# Altium schematic sheet 02_PHY_Automotive.SchDoc (part 1 of 2)
size B; SheetNumber: 2; SheetTotal: 5
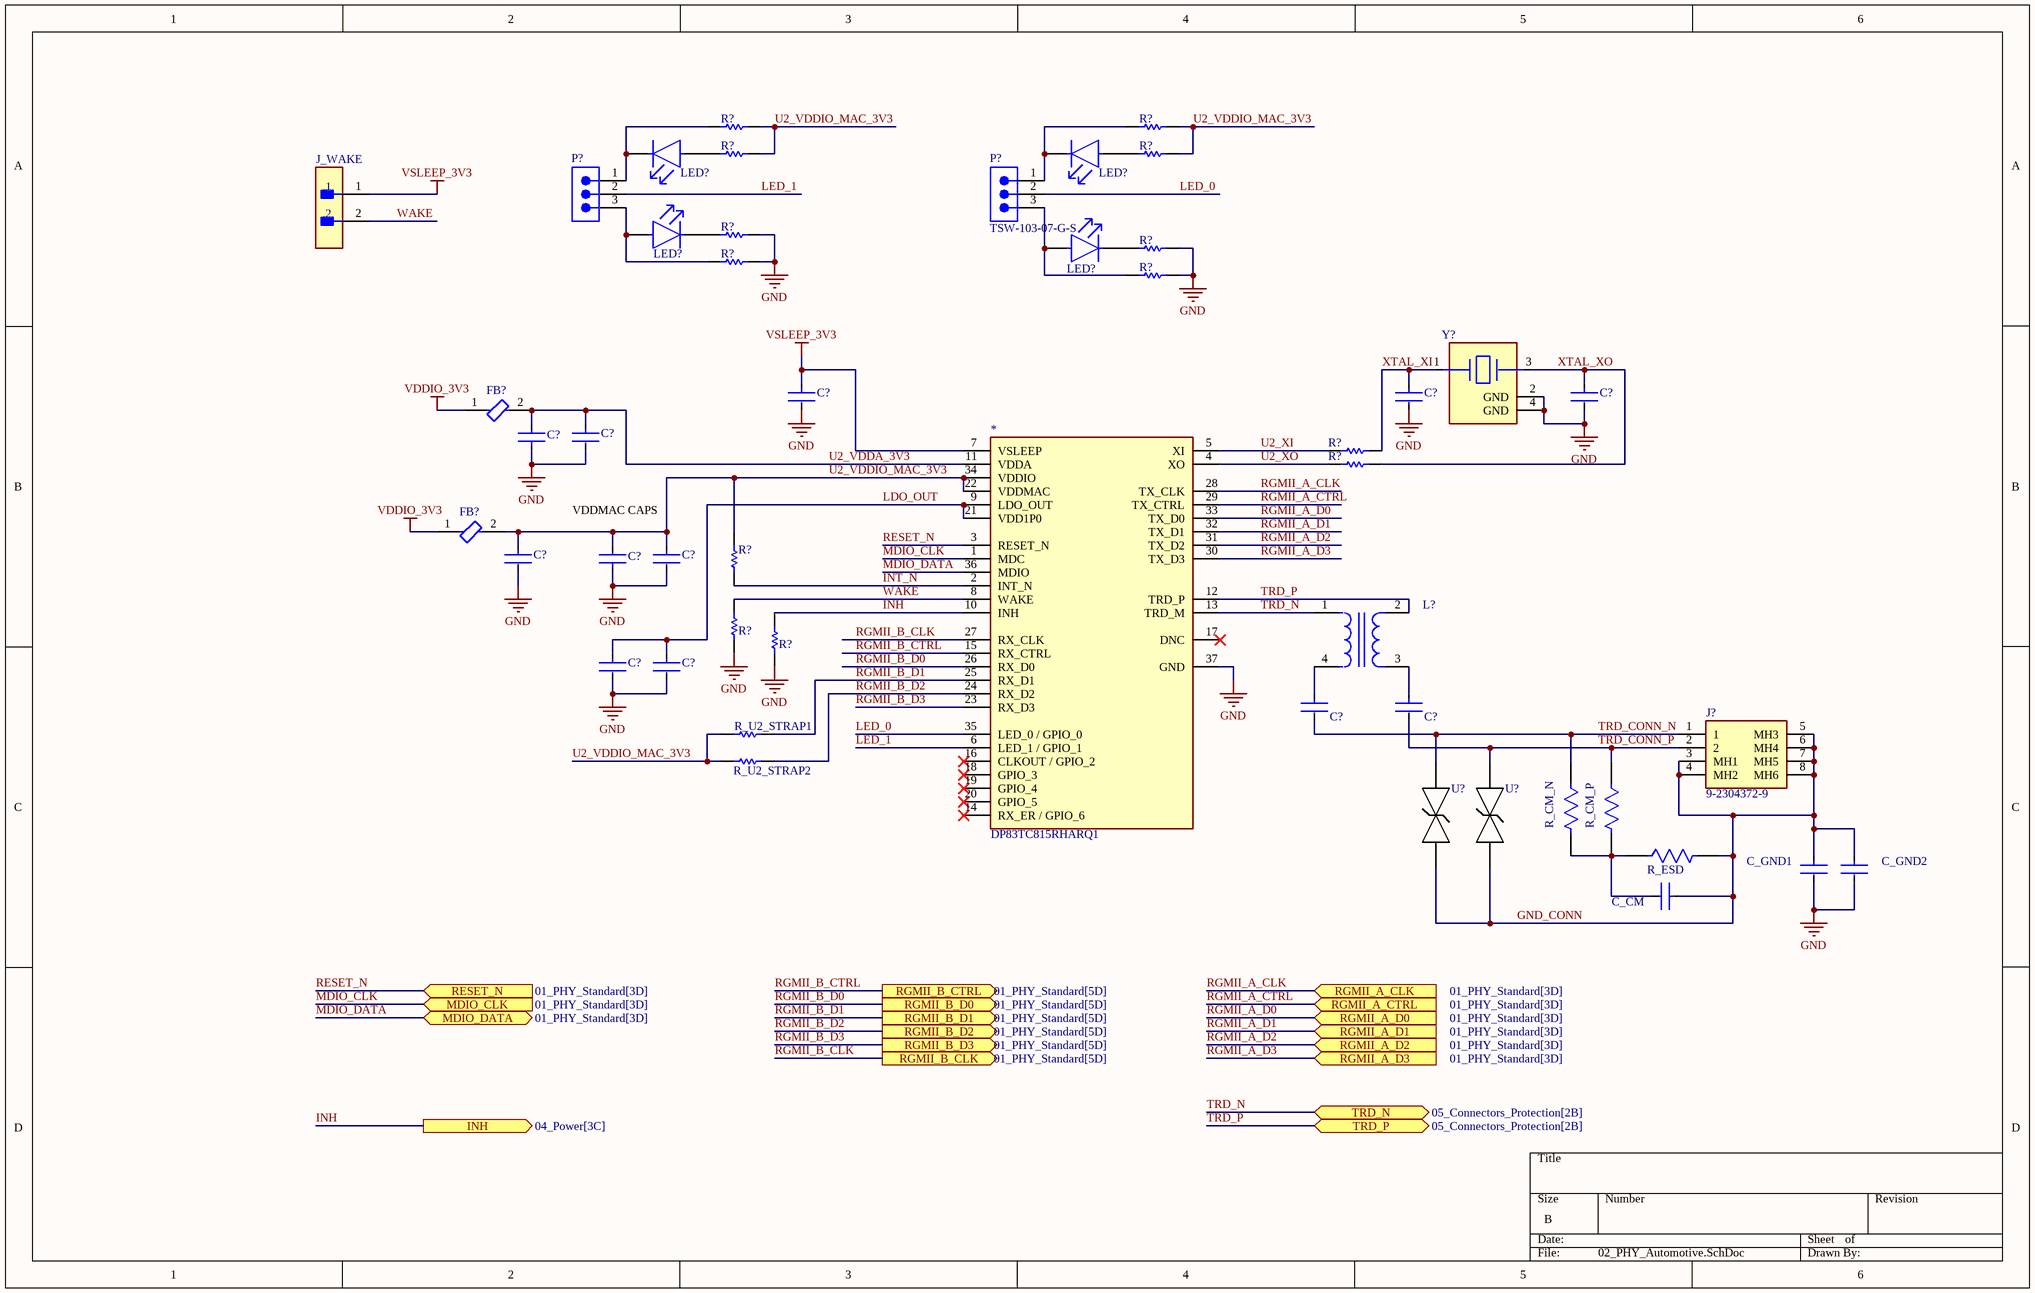
[diagram p0: 02_PHY_Automotive.SchDoc]

## Parts
(Parts that share a designator on the sheet are numbered #1, #2 ... from top to bottom, then left to right.)
*  DP83TC815RHARQ1  [FP-RHH0036C-MFG]
C?#1  GCG155R71C104KA01D  [FP-GCG155-0_1-IPC_C]  (value not drawn)
C?#2  C0402C220J5GACAUTO  [FP-AC0402-0_5-MFG]  (value not drawn)
C?#3  C0402C220J5GACAUTO  [FP-AC0402-0_5-MFG]  (value not drawn)
C?#4  AC0402KRX7R7BB103  [FP-AC0402-0_5-MFG]  (value not drawn)
C?#5  AC0603KRX7R7BB474  [FP-C0603-CJ-MFG]  (value not drawn)
C?#6  AC0402KRX7R7BB103  [FP-AC0402-0_5-MFG]  (value not drawn)
C?#7  AC0402KRX7R7BB103  [FP-AC0402-0_5-MFG]  (value not drawn)
C?#8  AC0603KRX7R7BB474  [FP-C0603-CJ-MFG]  (value not drawn)
C?#9  AC0805KKX7R6BB225  [FP-AC0805-0_85-MFG]  (value not drawn)
C?#10  GCG155R71C104KA01D  [FP-GCG155-0_1-IPC_C]  (value not drawn)
C?#11  (no value)  [FP-C0603-CJ-MFG]
C?#12  (no value)  [FP-C0603-CJ-MFG]
C_CM  (no value)  [FP-C0603-CJ-MFG]
C_GND1  CGA8M1X7R3A103K200KA  [FP-CGA8R-MFG]  (value not drawn)
C_GND2  CGA8M1X7R3A103K200KA  [FP-CGA8R-MFG]  (value not drawn)
FB?#1  BLM18KG601SH1D  [FP-BLM18-0_15-t0_8-IPC_B]  (value not drawn)
FB?#2  BLM18KG601SH1D  [FP-BLM18-0_15-t0_8-IPC_B]  (value not drawn)
J?  9-2304372-9  [923043729]
J_WAKE  TSW-102-22-G-S  [FP-TSW-102-22-G-S-MFG]  (value not drawn)
L?  ACT1210L-201-2P-TL00  [FP-ACT1210L-MFG]  (value not drawn)
LED?#1  SML-D12P8WT86C  [FP-SML-D12-MFG]  (value not drawn)
LED?#2  SML-D12P8WT86C  [FP-SML-D12-MFG]  (value not drawn)
LED?#3  SML-D12P8WT86C  [FP-SML-D12-MFG]  (value not drawn)
LED?#4  SML-D12P8WT86C  [FP-SML-D12-MFG]  (value not drawn)
P?#1  TSW-103-07-G-S  [SMTC-TSW-103-07-X-S]  (value not drawn)
P?#2  TSW-103-07-G-S  [SMTC-TSW-103-07-X-S]
R?#1  AC0402FR-072K49L  [FP-AC0402-IPC_A]  (value not drawn)
R?#2  AC0402FR-072K49L  [FP-AC0402-IPC_A]  (value not drawn)
R?#3  (no value)  [FP-AC0402-IPC_A]
R?#4  (no value)  [FP-AC0402-IPC_A]
R?#5  (no value)  [FP-AC0402-IPC_A]
R?#6  (no value)  [FP-AC0402-IPC_A]
R?#7  AC0402FR-072K49L  [FP-AC0402-IPC_A]  (value not drawn)
R?#8  AC0402FR-072K49L  [FP-AC0402-IPC_A]  (value not drawn)
R?#9  AC0402JR-13100RL  [FP-AC0402-IPC_A]  (value not drawn)
R?#10  AC0402JR-13100RL  [FP-AC0402-IPC_A]  (value not drawn)
R?#11  CRCW04022K20FKTD  [FP-AC0402-IPC_A]  (value not drawn)
R?#12  AC0402JR-1310KL  [FP-AC0402-IPC_A]  (value not drawn)
R?#13  AC0402JR-1310KL  [FP-AC0402-IPC_A]  (value not drawn)
R_CM_N  RK73HW2HTTE1001F  [FP-RK73HW2H-IPC_A]  (value not drawn)
R_CM_P  RK73HW2HTTE1001F  [FP-RK73HW2H-IPC_A]  (value not drawn)
R_ESD  AC0805FR-13100KL  [FP-AC0805-MFG]  (value not drawn)
R_U2_STRAP1  AC0402FR-072K49L  [FP-AC0402-IPC_A]  (value not drawn)
R_U2_STRAP2  AC0402FR-072K49L  [FP-AC0402-IPC_A]  (value not drawn)
U?#1  TPD1E01B04DPYRQ1  [DPY0002A-MFG]  (value not drawn)
U?#2  TPD1E01B04DPYRQ1  [DPY0002A-MFG]  (value not drawn)
Y?  TSX-3225 25.0000MF10P-C0  [FP-TSX-3225-MFG]  (value not drawn)

## Ports
INH (out, see 04_Power[3C]), MDIO_CLK (in, see 01_PHY_Standard[3D]), MDIO_DATA (bidir, see 01_PHY_Standard[3D]), RESET_N (in, see 01_PHY_Standard[3D]), RGMII_A_CLK (in, see 01_PHY_Standard[3D]), RGMII_A_CTRL (in, see 01_PHY_Standard[3D]), RGMII_A_D0 (in, see 01_PHY_Standard[3D]), RGMII_A_D1 (in, see 01_PHY_Standard[3D]), RGMII_A_D2 (in, see 01_PHY_Standard[3D]), RGMII_A_D3 (in, see 01_PHY_Standard[3D]), RGMII_B_CLK (out, see 01_PHY_Standard[5D]), RGMII_B_CTRL (out, see 01_PHY_Standard[5D]), RGMII_B_D0 (out, see 01_PHY_Standard[5D]), RGMII_B_D1 (out, see 01_PHY_Standard[5D]), RGMII_B_D2 (out, see 01_PHY_Standard[5D]), RGMII_B_D3 (out, see 01_PHY_Standard[5D]), TRD_N (bidir, see 05_Connectors_Protection[2B]), TRD_P (bidir, see 05_Connectors_Protection[2B])

## Nets
GND: *.37(GND) C?#1.2 C?#2.2 C?#3.2 C?#4.2 C?#5.2 C?#6.2 C?#7.2 C?#8.2 C?#9.2 C?#10.2 C_GND1.2 C_GND2.2 R?#5.1 R?#6.1 R?#7.1 R?#8.1 R?#12.2 R?#13.2 Y?.2(GND) Y?.4(GND)
VDDIO_3V3: FB?#1.1 FB?#2.1
VSLEEP_3V3: *.7(VSLEEP) C?#1.1 J_WAKE.1
GND_CONN: C_CM.2 C_GND1.1 C_GND2.1 J?.3(MH1) J?.4(MH2) J?.5(MH3) J?.6(MH4) J?.7(MH5) J?.8(MH6) R_ESD.2 U?#1.2 U?#2.2
INH: *.10(INH) R?#13.1 ; port INH
INT_N: *.2(INT_N) R?#11.2
LDO_OUT: *.9(LDO_OUT) *.21(VDD1P0) C?#9.1 C?#10.1
LED_0: *.35(LED_0_/_GPIO_0) P?#2.2
LED_1: *.6(LED_1_/_GPIO_1) P?#1.2
MDIO_CLK: *.1(MDC) ; port MDIO_CLK
MDIO_DATA: *.36(MDIO) ; port MDIO_DATA
RESET_N: *.3(RESET_N) ; port RESET_N
RGMII_A_CLK: *.28(TX_CLK) ; port RGMII_A_CLK
RGMII_A_CTRL: *.29(TX_CTRL) ; port RGMII_A_CTRL
RGMII_A_D0: *.33(TX_D0) ; port RGMII_A_D0
RGMII_A_D1: *.32(TX_D1) ; port RGMII_A_D1
RGMII_A_D2: *.31(TX_D2) ; port RGMII_A_D2
RGMII_A_D3: *.30(TX_D3) ; port RGMII_A_D3
RGMII_B_CLK: *.27(RX_CLK) ; port RGMII_B_CLK
RGMII_B_CTRL: *.15(RX_CTRL) ; port RGMII_B_CTRL
RGMII_B_D0: *.26(RX_D0) ; port RGMII_B_D0
RGMII_B_D1: *.25(RX_D1) R_U2_STRAP1.2 ; port RGMII_B_D1
RGMII_B_D2: *.24(RX_D2) R_U2_STRAP2.1 ; port RGMII_B_D2
RGMII_B_D3: *.23(RX_D3) ; port RGMII_B_D3
TRD_CONN_N: C?#11.1 J?.1 R_CM_N.1 U?#1.1
TRD_CONN_P: C?#12.1 J?.2 R_CM_P.1 U?#2.1
TRD_N: *.13(TRD_M) L?.1 ; port TRD_N
TRD_P: *.12(TRD_P) L?.2 ; port TRD_P
U2_VDDA_3V3: *.11(VDDA) C?#4.1 C?#5.1 FB?#1.2
U2_VDDIO_MAC_3V3: *.22(VDDMAC) *.34(VDDIO) C?#6.1 C?#7.1 C?#8.1 FB?#2.2 R?#1.1 R?#2.1 R?#3.1 R?#4.1 R?#11.1 R_U2_STRAP1.1 R_U2_STRAP2.2
U2_XI: *.5(XI) R?#9.2
U2_XO: *.4(XO) R?#10.2
WAKE: *.8(WAKE) J_WAKE.2 R?#12.1
XTAL_XI: C?#2.1 R?#9.1 Y?.1
XTAL_XO: C?#3.1 R?#10.1 Y?.3
NetC?#11_2: C?#11.2 L?.4
NetC?#12_2: C?#12.2 L?.3
NetC_CM_1: C_CM.1 R_CM_N.2 R_CM_P.2 R_ESD.1
NetLED?#1_1: LED?#1.1(C) P?#1.1 R?#1.2
NetLED?#1_2: LED?#1.2(A) R?#3.2
NetLED?#2_1: LED?#2.1(C) P?#2.1 R?#2.2
NetLED?#2_2: LED?#2.2(A) R?#4.2
NetLED?#3_1: LED?#3.1(C) R?#5.2
NetLED?#3_2: LED?#3.2(A) P?#1.3 R?#7.2
NetLED?#4_1: LED?#4.1(C) R?#6.2
NetLED?#4_2: LED?#4.2(A) P?#2.3 R?#8.2

Not connected (* = marked no-connect by the designer): * 14(RX_ER_/_GPIO_6)* 16(CLKOUT_/_GPIO_2)* 17(DNC)* 18(GPIO_3)* 19(GPIO_4)* 20(GPIO_5)*

## Notes on the sheet
- (near C?#8) VDDMAC CAPS